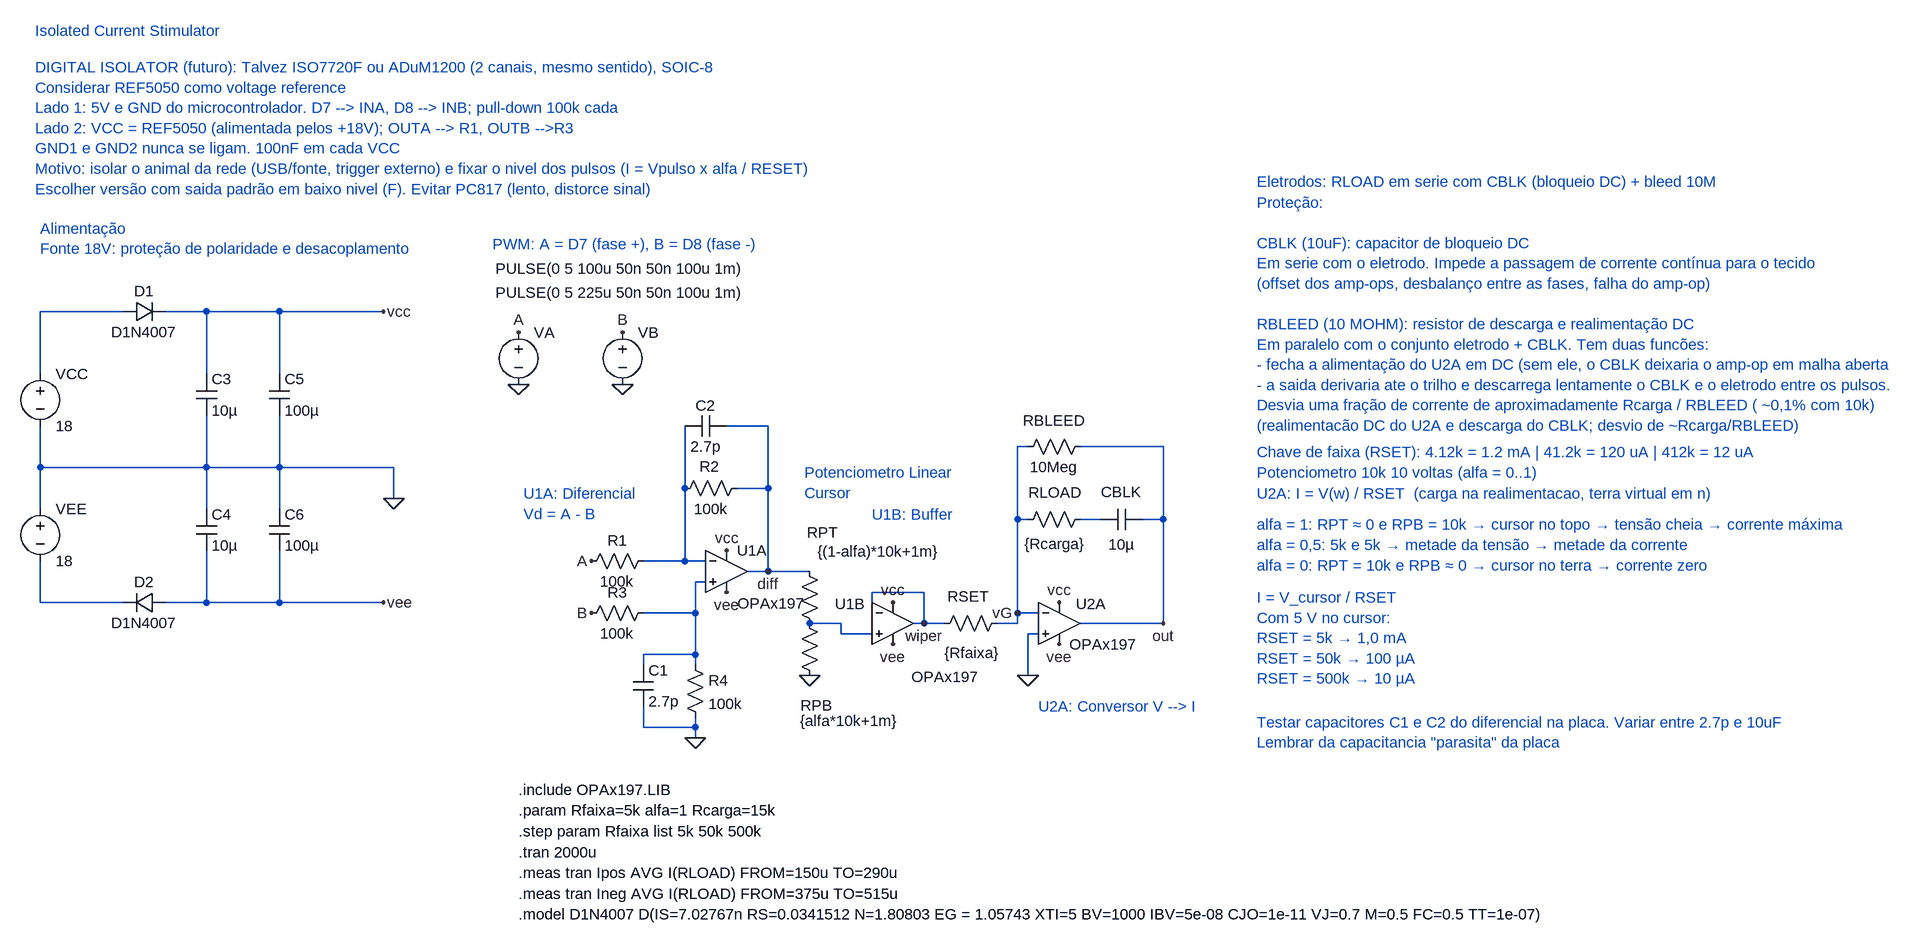
[diagram p0: schematic gila_stim_opax197.asc]
gila_stim_opax197.asc, the LTspice schematic file:
Version 4.1
SHEET 1 3020 1000
WIRE -944 -352 -1072 -352
WIRE -816 -352 -880 -352
WIRE -704 -352 -816 -352
WIRE -544 -352 -704 -352
WIRE -1072 -256 -1072 -352
WIRE -816 -256 -816 -352
WIRE -704 -256 -704 -352
WIRE 48 -176 -16 -176
WIRE 448 -144 432 -144
WIRE 656 -144 528 -144
WIRE -1072 -112 -1072 -176
WIRE -816 -112 -816 -192
WIRE -816 -112 -1072 -112
WIRE -704 -112 -704 -192
WIRE -704 -112 -816 -112
WIRE -528 -112 -704 -112
WIRE -80 -80 -80 -176
WIRE 48 -80 48 -176
WIRE 48 -80 0 -80
WIRE -528 -64 -528 -112
WIRE -1072 -48 -1072 -112
WIRE -816 -48 -816 -112
WIRE -704 -48 -704 -112
WIRE 432 -32 432 -144
WIRE 448 -32 432 -32
WIRE 560 -32 528 -32
WIRE 656 -32 656 -144
WIRE 656 -32 624 -32
WIRE -80 32 -80 -80
WIRE -80 32 -144 32
WIRE -48 32 -80 32
WIRE 48 48 48 -80
WIRE 48 48 16 48
WIRE 112 48 48 48
WIRE -48 64 -64 64
WIRE 288 80 208 80
WIRE -1072 96 -1072 32
WIRE -944 96 -1072 96
WIRE -816 96 -816 16
WIRE -816 96 -880 96
WIRE -704 96 -704 16
WIRE -704 96 -816 96
WIRE -544 96 -704 96
WIRE -64 112 -64 64
WIRE -64 112 -144 112
WIRE 208 112 208 80
WIRE 432 112 432 -32
WIRE 464 112 432 112
WIRE 160 128 112 128
WIRE 288 128 288 80
WIRE 288 128 272 128
WIRE 320 128 288 128
WIRE 432 128 432 112
WIRE 432 128 400 128
WIRE 656 128 656 -32
WIRE 656 128 528 128
WIRE 160 144 160 128
WIRE 208 144 160 144
WIRE 464 144 448 144
WIRE -64 176 -64 112
WIRE -64 176 -144 176
WIRE -144 192 -144 176
WIRE -64 192 -64 176
WIRE 448 208 448 144
WIRE -144 288 -144 256
WIRE -64 288 -64 272
WIRE -64 288 -144 288
WIRE -64 304 -64 288
FLAG -336 -320 A
FLAG -336 -240 0
FLAG -176 -320 B
FLAG -176 -240 0
FLAG -544 -352 vcc
FLAG -528 -64 0
FLAG -544 96 vee
FLAG -16 16 vcc
FLAG -16 80 vee
FLAG -224 32 A
FLAG -224 112 B
FLAG -64 304 0
FLAG 48 48 diff
FLAG 112 208 0
FLAG 240 96 vcc
FLAG 240 160 vee
FLAG 288 128 wiper
FLAG 496 96 vcc
FLAG 496 160 vee
FLAG 448 208 0
FLAG 432 112 vG
FLAG 656 128 out
SYMBOL voltage -336 -336 R0
WINDOW 123 0 0 Left 0
WINDOW 39 0 0 Left 0
WINDOW 3 -35 -82 Left 2
SYMATTR Value PULSE(0 5 100u 50n 50n 100u 1m)
SYMATTR InstName VA
SYMBOL voltage -176 -336 R0
WINDOW 123 0 0 Left 0
WINDOW 39 0 0 Left 0
WINDOW 3 -195 -45 Left 2
SYMATTR Value PULSE(0 5 225u 50n 50n 100u 1m)
SYMATTR InstName VB
SYMBOL voltage -1072 -272 R0
WINDOW 123 0 0 Left 0
WINDOW 39 0 0 Left 0
SYMATTR InstName VCC
SYMATTR Value 18
SYMBOL voltage -1072 -64 R0
WINDOW 123 0 0 Left 0
WINDOW 39 0 0 Left 0
SYMATTR InstName VEE
SYMATTR Value 18
SYMBOL OpAmps\\opamp2 -16 -16 R0
WINDOW 3 17 113 Left 2
SYMATTR Value OPAx197
SYMATTR InstName U1A
SYMBOL res -128 16 R90
WINDOW 0 0 56 VBottom 2
WINDOW 3 32 56 VTop 2
SYMATTR InstName R1
SYMATTR Value 100k
SYMBOL res 16 -96 R90
WINDOW 0 -2 58 VBottom 2
WINDOW 3 32 56 VTop 2
SYMATTR InstName R2
SYMATTR Value 100k
SYMBOL res -128 96 R90
WINDOW 0 0 56 VBottom 2
WINDOW 3 32 56 VTop 2
SYMATTR InstName R3
SYMATTR Value 100k
SYMBOL res -80 176 R0
SYMATTR InstName R4
SYMATTR Value 100k
SYMBOL res 96 32 R0
WINDOW 0 12 -44 Left 2
WINDOW 3 123 -30 Top 2
SYMATTR InstName RPT
SYMATTR Value {(1-alfa)*10k+1m}
SYMBOL res 96 112 R0
WINDOW 0 2 142 Left 2
WINDOW 3 1 166 Left 2
SYMATTR InstName RPB
SYMATTR Value {alfa*10k+1m}
SYMBOL OpAmps\\opamp2 240 64 R0
WINDOW 0 -89 34 Left 2
WINDOW 3 29 146 Left 2
SYMATTR InstName U1B
SYMATTR Value OPAx197
SYMBOL res 416 112 R90
WINDOW 0 -10 60 VBottom 2
WINDOW 3 46 54 VTop 2
SYMATTR InstName RSET
SYMATTR Value {Rfaixa}
SYMATTR SpiceLine tol=1
SYMBOL OpAmps\\opamp2 496 64 R0
WINDOW 0 26 34 Left 2
SYMATTR InstName U2A
SYMATTR Value OPAx197
SYMBOL res 544 -160 R90
WINDOW 0 -9 56 VBottom 2
WINDOW 3 32 56 VTop 2
SYMATTR InstName RBLEED
SYMATTR Value 10Meg
SYMBOL res 544 -48 R90
WINDOW 0 -10 54 VBottom 2
WINDOW 3 38 54 VTop 2
SYMATTR InstName RLOAD
SYMATTR Value {Rcarga}
SYMBOL cap 624 -48 R90
WINDOW 0 -11 33 VBottom 2
WINDOW 3 39 32 VTop 2
SYMATTR InstName CBLK
SYMATTR Value 10µ
SYMBOL cap -160 192 R0
SYMATTR InstName C1
SYMATTR Value 2.7p
SYMBOL cap -80 -160 R270
WINDOW 0 32 32 VTop 2
WINDOW 3 0 32 VBottom 2
SYMATTR InstName C2
SYMATTR Value 2.7p
SYMBOL diode -880 80 R90
WINDOW 0 0 32 VBottom 2
WINDOW 3 32 32 VTop 2
SYMATTR InstName D2
SYMATTR Value D1N4007
SYMBOL diode -944 -336 R270
WINDOW 0 32 32 VTop 2
WINDOW 3 0 32 VBottom 2
SYMATTR InstName D1
SYMATTR Value D1N4007
SYMBOL cap -832 -256 R0
SYMATTR InstName C3
SYMATTR Value 10µ
SYMBOL cap -832 -48 R0
SYMATTR InstName C4
SYMATTR Value 10µ
SYMBOL cap -720 -256 R0
SYMATTR InstName C5
SYMATTR Value 100µ
SYMBOL cap -720 -48 R0
SYMATTR InstName C6
SYMATTR Value 100µ
TEXT -376 -456 Left 2 ;PWM: A = D7 (fase +), B = D8 (fase -)
TEXT -328 -72 Left 2 ;U1A: Diferencial\nVd = A - B
TEXT 800 -104 Left 2 ;Potenciometro 10k 10 voltas (alfa = 0..1)
TEXT 800 -136 Left 2 ;Chave de faixa (RSET): 4.12k = 1.2 mA | 41.2k = 120 uA | 412k = 12 uA
TEXT 800 -552 Left 2 ;Eletrodos: RLOAD em serie com CBLK (bloqueio DC) + bleed 10M
TEXT 800 -72 Left 2 ;U2A: I = V(w) / RSET  (carga na realimentacao, terra virtual em n)
TEXT -336 384 Left 2 !.include OPAx197.LIB
TEXT -336 416 Left 2 !.param Rfaixa=5k alfa=1 Rcarga=15k
TEXT -336 448 Left 2 !.step param Rfaixa list 5k 50k 500k
TEXT -336 480 Left 2 !.tran 2000u
TEXT -336 512 Left 2 !.meas tran Ipos AVG I(RLOAD) FROM=150u TO=290u
TEXT -336 544 Left 2 !.meas tran Ineg AVG I(RLOAD) FROM=375u TO=515u
TEXT 800 -24 Left 2 ;alfa = 1: RPT ≈ 0 e RPB = 10k → cursor no topo → tensão cheia → corrente máxima\nalfa = 0,5: 5k e 5k → metade da tensão → metade da corrente\nalfa = 0: RPT = 10k e RPB ≈ 0 → cursor no terra → corrente zero
TEXT 800 88 Left 2 ;I = V_cursor / RSET\nCom 5 V no cursor:\nRSET = 5k → 1,0 mA\nRSET = 50k → 100 µA\nRSET = 500k → 10 µA
TEXT 208 -40 Left 2 ;U1B: Buffer
TEXT 104 -104 Left 2 ;Potenciometro Linear\nCursor
TEXT 464 256 Left 2 ;U2A: Conversor V --> I
TEXT 800 280 Left 2 ;Testar capacitores C1 e C2 do diferencial na placa. Variar entre 2.7p e 10uF\nLembrar da capacitancia "parasita" da placa
TEXT -1072 -480 Left 2 ;Alimentação\nFonte 18V: proteção de polaridade e desacoplamento
TEXT -336 576 Left 2 !.model D1N4007 D(IS=7.02767n RS=0.0341512 N=1.80803 EG = 1.05743 XTI=5 BV=1000 IBV=5e-08 CJO=1e-11 VJ=0.7 M=0.5 FC=0.5 TT=1e-07)
TEXT -1080 -784 Left 2 ;Isolated Current Stimulator
TEXT -1080 -728 Left 2 ;DIGITAL ISOLATOR (futuro): Talvez ISO7720F ou ADuM1200 (2 canais, mesmo sentido), SOIC-8\nConsiderar REF5050 como voltage reference\nLado 1: 5V e GND do microcontrolador. D7 --> INA, D8 --> INB; pull-down 100k cada\nLado 2: VCC = REF5050 (alimentada pelos +18V); OUTA --> R1, OUTB -->R3\nGND1 e GND2 nunca se ligam. 100nF em cada VCC\nMotivo: isolar o animal da rede (USB/fonte, trigger externo) e fixar o nivel dos pulsos (I = Vpulso x alfa / RESET)\nEscolher versão com saida padrão em baixo nivel (F). Evitar PC817 (lento, distorce sinal)
TEXT 800 -520 Left 2 ;Proteção:\n \nCBLK (10uF): capacitor de bloqueio DC\nEm serie com o eletrodo. Impede a passagem de corrente contínua para o tecido \n(offset dos amp-ops, desbalanço entre as fases, falha do amp-op)\n \nRBLEED (10 MOHM): resistor de descarga e realimentação DC\nEm paralelo com o conjunto eletrodo + CBLK. Tem duas funcões:\n- fecha a alimentação do U2A em DC (sem ele, o CBLK deixaria o amp-op em malha aberta\n- a saida derivaria ate o trilho e descarrega lentamente o CBLK e o eletrodo entre os pulsos. \nDesvia uma fração de corrente de aproximadamente Rcarga / RBLEED ( ~0,1% com 10k)\n(realimentacão DC do U2A e descarga do CBLK; desvio de ~Rcarga/RBLEED)

The netlist it stands for:
* gila_stim_opax197.asc
VA A 0 PULSE(0 5 100u 50n 50n 100u 1m)
VB B 0 PULSE(0 5 225u 50n 50n 100u 1m)
VCC N001 0 18
VEE 0 N005 18
X§U1A N004 N002 vcc vee diff OPAx197  ; pins In+ In- V+ V- OUT
R1 N002 A 100k
R2 diff N002 100k
R3 N004 B 100k
R4 N004 0 100k
RPT diff N006 {(1-alfa)*10k+1m}
RPB N006 0 {alfa*10k+1m}
X§U1B N006 wiper vcc vee wiper OPAx197  ; pins In+ In- V+ V- OUT
RSET vG wiper {Rfaixa} tol=1
X§U2A 0 vG vcc vee out OPAx197  ; pins In+ In- V+ V- OUT
RBLEED out vG 10Meg
RLOAD N003 vG {Rcarga}
CBLK out N003 10µ
C1 N004 0 2.7p
C2 N002 diff 2.7p
D2 vee N005 D1N4007
D1 N001 vcc D1N4007
C3 vcc 0 10µ
C4 0 vee 10µ
C5 vcc 0 100µ
C6 0 vee 100µ
.model D D
.lib standard.dio
* PWM: A = D7 (fase +), B = D8 (fase -)
* U1A: Diferencial
* Vd = A - B
* Potenciometro 10k 10 voltas (alfa = 0..1)
* Chave de faixa (RSET): 4.12k = 1.2 mA | 41.2k = 120 uA | 412k = 12 uA
* Eletrodos: RLOAD em serie com CBLK (bloqueio DC) + bleed 10M
* U2A: I = V(w) / RSET  (carga na realimentacao, terra virtual em n)
.include OPAx197.LIB
.param Rfaixa=5k alfa=1 Rcarga=15k
.step param Rfaixa list 5k 50k 500k
.tran 2000u
.meas tran Ipos AVG I(RLOAD) FROM=150u TO=290u
.meas tran Ineg AVG I(RLOAD) FROM=375u TO=515u
* alfa = 1: RPT ≈ 0 e RPB = 10k → cursor no topo → tensão cheia → corrente máxima
* alfa = 0,5: 5k e 5k → metade da tensão → metade da corrente
* alfa = 0: RPT = 10k e RPB ≈ 0 → cursor no terra → corrente zero
* I = V_cursor / RSET
* Com 5 V no cursor:
* RSET = 5k → 1,0 mA
* RSET = 50k → 100 µA
* RSET = 500k → 10 µA
* U1B: Buffer
* Potenciometro Linear
* Cursor
* U2A: Conversor V --> I
* Testar capacitores C1 e C2 do diferencial na placa. Variar entre 2.7p e 10uF
* Lembrar da capacitancia "parasita" da placa
* Alimentação
* Fonte 18V: proteção de polaridade e desacoplamento
.model D1N4007 D(IS=7.02767n RS=0.0341512 N=1.80803 EG = 1.05743 XTI=5 BV=1000 IBV=5e-08 CJO=1e-11 VJ=0.7 M=0.5 FC=0.5 TT=1e-07)
* Isolated Current Stimulator
* DIGITAL ISOLATOR (futuro): Talvez ISO7720F ou ADuM1200 (2 canais, mesmo sentido), SOIC-8
* Considerar REF5050 como voltage reference
* Lado 1: 5V e GND do microcontrolador. D7 --> INA, D8 --> INB; pull-down 100k cada
* Lado 2: VCC = REF5050 (alimentada pelos +18V); OUTA --> R1, OUTB -->R3
* GND1 e GND2 nunca se ligam. 100nF em cada VCC
* Motivo: isolar o animal da rede (USB/fonte, trigger externo) e fixar o nivel dos pulsos (I = Vpulso x alfa / RESET)
* Escolher versão com saida padrão em baixo nivel (F). Evitar PC817 (lento, distorce sinal)
* Proteção:
* CBLK (10uF): capacitor de bloqueio DC
* Em serie com o eletrodo. Impede a passagem de corrente contínua para o tecido
* (offset dos amp-ops, desbalanço entre as fases, falha do amp-op)
* RBLEED (10 MOHM): resistor de descarga e realimentação DC
* Em paralelo com o conjunto eletrodo + CBLK. Tem duas funcões:
* - fecha a alimentação do U2A em DC (sem ele, o CBLK deixaria o amp-op em malha aberta
* - a saida derivaria ate o trilho e descarrega lentamente o CBLK e o eletrodo entre os pulsos.
* Desvia uma fração de corrente de aproximadamente Rcarga / RBLEED ( ~0,1% com 10k)
* (realimentacão DC do U2A e descarga do CBLK; desvio de ~Rcarga/RBLEED)
.backanno
.end